# Altium schematic sheet Alimentación.SchDoc
size A4; SheetNumber: 3; SheetTotal: 7
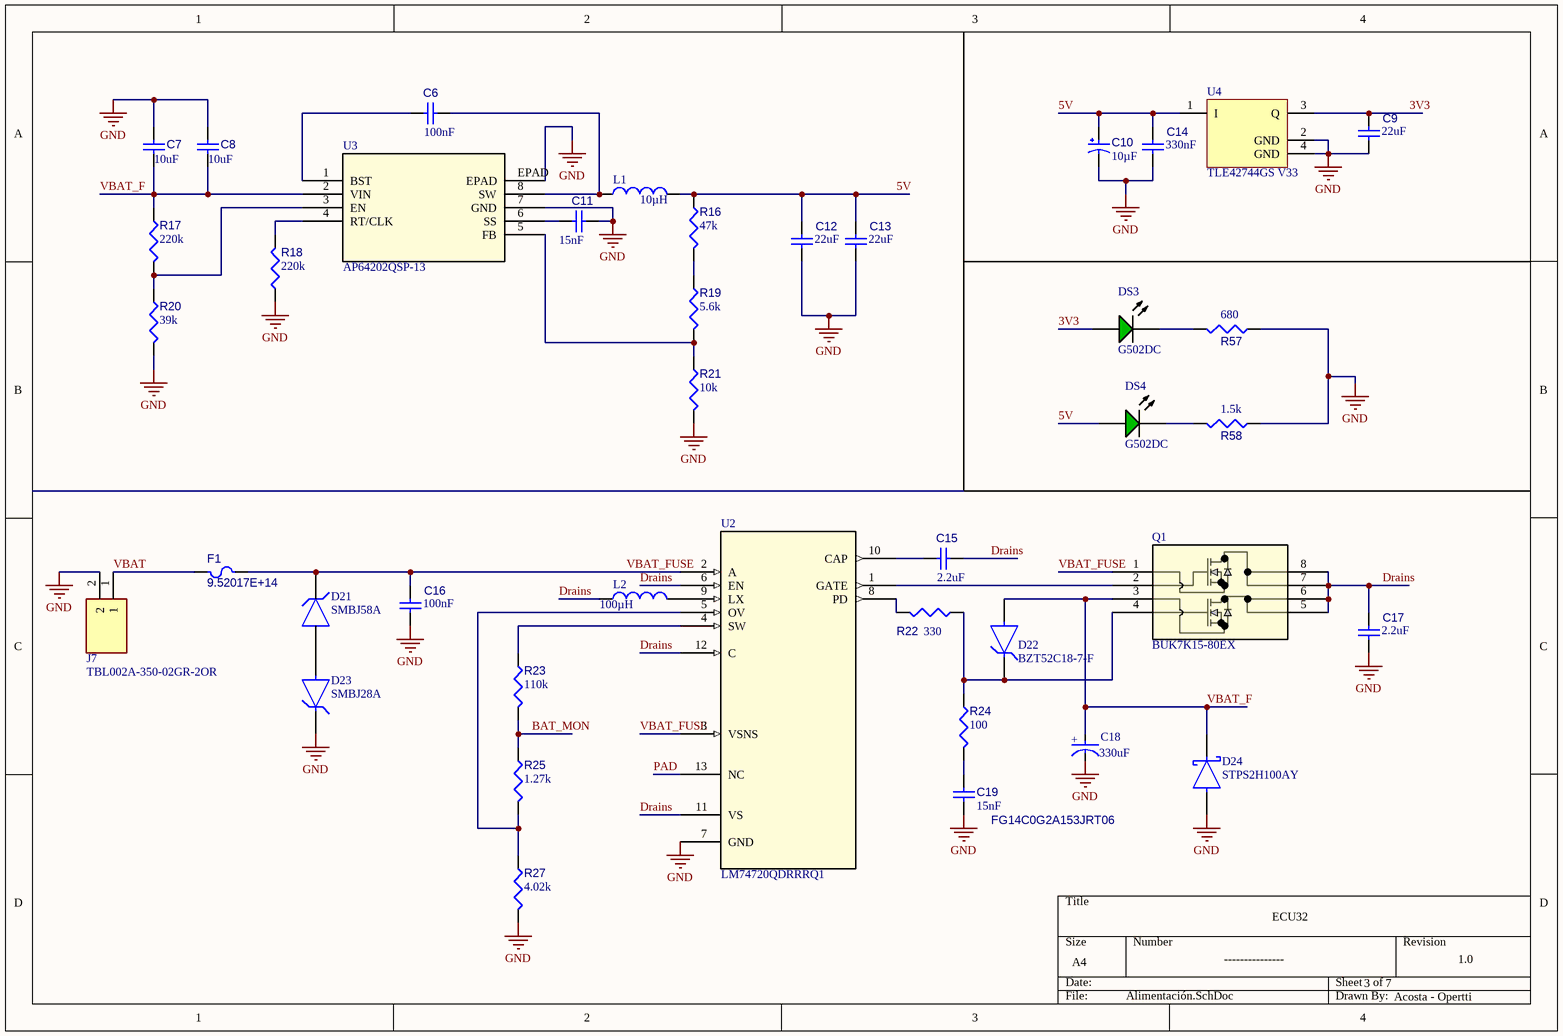
[diagram p0: Alimentación.SchDoc]

## Parts
C6  value 100nF  [Capacitor cerámico TH-Footprint-1]  (hidden comment: Capacitor cerámico TH)
C7  value 10uF  [Capacitor cerámico TH-Footprint-1]  (hidden comment: Capacitor cerámico TH)
C8  value 10uF  [Capacitor cerámico TH-Footprint-1]  (hidden comment: Capacitor cerámico TH)
C9  value 22uF  [Capacitor cerámico TH-Footprint-1]  (hidden comment: Capacitor cerámico TH)
C10  value 10µF  [CAPPR55-200-1100X500X1200]  (hidden comment: ECA1HM100)
C11  value 15nF  [Capacitor cerámico TH-Footprint-1]  (hidden comment: Capacitor cerámico TH)
C12  value 22uF  [Capacitor cerámico TH-Footprint-1]  (hidden comment: Capacitor cerámico TH)
C13  value 22uF  [Capacitor cerámico TH-Footprint-1]  (hidden comment: Capacitor cerámico TH)
C14  value 330nF  [Capacitor cerámico TH-Footprint-1]  (hidden comment: Capacitor cerámico TH)
C15  value 2.2uF  [Capacitor cerámico TH-Footprint-1]  (hidden comment: Capacitor cerámico TH)
C16  value 100nF  [Capacitor cerámico TH-Footprint-1]  (hidden comment: Capacitor cerámico TH)
C17  value 2.2uF  [Capacitor cerámico TH-Footprint-1]  (hidden comment: Capacitor cerámico TH)
C18  330uF  [FP-RAD-TH-D_10_0_5-L_16_1-MFG]
C19  FG14C0G2A153JRT06  value 15nF  [FG14C0G2A153JRT06-Footprint-1]
D21  SMBJ58A  [FP-SMBJ-MFG]
D22  BZT52C18-7-F  [FP-SOD123-MFG]
D23  SMBJ28A  [FP-SMBJ-MFG]
D24  STPS2H100AY  [FP-SMA-MFG]
DS3  G502DC  [CGX-G502DC]
DS4  G502DC  [CGX-G502DC]
F1  9.52017E+14  [9.52017E+14-Footprint-1]
J7  TBL002A-350-02GR-2OR  [CUI_TBL002A-350-02GR-2OR]
L1  value 10µH  [INDC115100X400M]  (hidden comment: HPAL1V1040-100-R)
L2  value 100µH  [SRN6045TA-101M-Footprint-1]  (hidden comment: SRN6045TA-101M)
Q1  BUK7K15-80EX  [BUK7K15-80EX-Footprint-1]
R16  value 47k  [RESA60-630X240]  (hidden comment: MFR-25FBF52-47R5)
R17  value 220k  [RESA60-630X240]  (hidden comment: MFR-25FBF52-47R5)
R18  value 220k  [RESA60-630X240]  (hidden comment: MFR-25FBF52-47R5)
R19  value 5.6k  [RESA60-630X240]  (hidden comment: MFR-25FBF52-47R5)
R20  value 39k  [RESA60-630X240]  (hidden comment: MFR-25FBF52-47R5)
R21  value 10k  [RESA60-630X240]  (hidden comment: MFR-25FBF52-47R5)
R22  value 330  [RESA60-630X240]  (hidden comment: MFR-25FBF52-47R5)
R23  value 110k  [RESA60-630X240]  (hidden comment: MFR-25FBF52-47R5)
R24  value 100  [RESA60-630X240]  (hidden comment: MFR-25FBF52-47R5)
R25  value 1.27k  [RESA60-630X240]  (hidden comment: MFR-25FBF52-47R5)
R27  value 4.02k  [RESA60-630X240]  (hidden comment: MFR-25FBF52-47R5)
R57  value 680  [RESA60-630X240]  (hidden comment: MFR-25FBF52-47R5)
R58  value 1.5k  [RESA60-630X240]  (hidden comment: MFR-25FBF52-47R5)
U2  LM74720QDRRRQ1  [LM74720QDRRRQ1-Footprint-1]
U3  AP64202QSP-13  [IC8_AP64202SP-13_DIO]
U4  TLE42744GS V33  [INF-PG-SOT223_SC-73_M]

## Nets
GND: C7.2 C8.2 C9.1 C10.2 C11.2 C12.2 C13.2 C14.1 C16.1 C17.1 C18.1(C) C19.1 D23.1(C) D24.2(A) J7.2 R18.1 R20.2 R21.2 R27.2 R57.2 R58.2 U2.7(GND) U3.7(GND) U3.EPAD U4.2(GND) U4.4(GND)
3V3: C9.2 DS3.1(A) U4.3(Q)
5V: C10.1 C12.1 C13.1 C14.2 DS4.1(A) L1.2 R16.1 U4.1(I)
BAT_MON: R23.2 R25.1
Drains: C15.2 C17.2 L2.1 Q1.5 Q1.6 Q1.7 Q1.8 U2.6(EN) U2.11(VS) U2.12(C)
PAD: U2.13(NC)
VBAT: F1.1 J7.1
VBAT_F: C7.1 C8.1 C18.2(A) D22.2(A) D24.1(K) Q1.3 R17.1 U3.2(VIN)
VBAT_FUSE: C16.2 D21.1(C) F1.2 Q1.1 U2.2(A) U2.3(VSNS)
NetC6_1: C6.1 U3.1(BST)
NetC6_2: C6.2 L1.1 U3.8(SW)
NetC11_1: C11.1 U3.6(SS)
NetC15_1: C15.1 U2.10(CAP)
NetC19_2: C19.2 R24.2
NetD21_2: D21.2(A) D23.2(A)
NetD22_1: D22.1(C) Q1.4 R22.1 R24.1
NetDS3_2: DS3.2(K) R57.1
NetDS4_2: DS4.2(K) R58.1
NetL2_2: L2.2 U2.9(LX)
NetQ1_2: Q1.2 U2.1(GATE)
NetR16_2: R16.2 R19.1
NetR17_2: R17.2 R20.1 U3.3(EN)
NetR18_2: R18.2 U3.4(RT/CLK)
NetR19_2: R19.2 R21.1 U3.5(FB)
NetR22_2: R22.2 U2.8(PD)
NetR23_1: R23.1 U2.4(SW)
NetR25_2: R25.2 R27.1 U2.5(OV)

## Notes on the sheet
- ECU32
- ---------------
- 3
- 7
- 1.0
- Acosta - Opertti
- (in symbol CMP-05427-000698-1) +

## Library data of the parts
C6-C9 C11-C17 = CMP-001-00083-4
C10 = CMP-001-00025-7: Aluminum Electrolytic Capacitor, 10 uF, +/- 20%, 50 V, -40 to 85 degC, 2-Pin THD, RoHS, Bulk; Manufacturer: Panasonic; Ripple Current (AC): 65mA; Voltage Rating: 50V; Mounting Technology: TH; RoHS Compliant: True; Capacitor Type: Electrolytic; Datasheet Version: Rev. 05, 10/2016; Min Operating Temperature: -40°C; Packaging: Bulk; Ripple Current: 65mA; Tolerance: 20%; Max Operating Temperature: 85°C; Datasheet URL: https://industrial.panasonic.com/cdbs/www-data/pdf/RDF0000/ABA0000C1218.pdf; Lead Pitch: 2mm; Pins: 2; Diameter: 5mm; Manufacturer URL: http://www.panasonic.com/; Package Reference: CAPPR55-200-1100X500X1200; Package Description: 2-Pin Radial Lead, Dia 5 mm, Height 12 mm; Case/Package: Radial; Package Quantity: 200
C18 = CMP-05427-000698-1: Aluminum Electrolytic Capacitors (Radial Lead Type) AEC-Q200 Qualified 330uF ±20% 50V; Life (Hours): 2000Hour; Ripple Current: 410mA; Lead Diameter: 0.6mm; Lead/Base Style: Straight; Diameter: 10mm; Termination: Radial; Length: 16mm; Construction: RADIAL; Lead Pitch: 5mm; Mount: Through Hole; Max Operating Temperature: 105°C; Package Quantity: 500; Packaging: Ammo Pack; Voltage Rating (DC): 50V; Contact Plating: Tin; Min Operating Temperature: -55°C; Capacitance: 330uF; Height: 16mm; Series: NHG; Tolerance: 20%; RoHS Compliant: Yes; Case/Package: Radial; Radiation Hardening: No
C19 = CMP-001-00084-1: 卤5% 100V 15nF C0G Plugin Multilayer Ceramic Capacitors MLCC - Leaded ROHS; Tolerance: 5%; Max Operating Temperature: 125°C; Mounting Technology: Through Hole; Min Operating Temperature: -55°C
D21 = CMP-08607-000075-1: TVS DIODE 58V 93.6V DO214AA; Manufacturer: Littelfuse Inc; Breakdown Voltage: 64.4V; Peak Pulse Power: 600W; Automotive Grade: Grade 0; Number Of Channels: 1; Max Junction Temp: +150°C; Peak Pulse Current: 6.5A; Direction: Unidirectional; Manufacturer Part Number: SMBJ58A; Lead Free: Yes; Device Class L3: unset; Temperature: -55°C to +150°C; ComponentLink2URL: https://www.littelfuse.com/~/media/electronics/datasheets/tvs_diodes/littelfuse_tvs_diode_smbj_datasheet.pdf.pdf; Device Class L2: TVS Diodes; RoHS: TRUE; Package: SMBJ; Reverse Standoff Voltage: 58V; Height: 2.61mm; Temperature Range Low: -55°C; Clamping Voltage: 93.6V; Temperature Range High: +150°C; Automotive: Yes; Mouser Description: In a Pack of 20, Littelfuse SMBJ58A, Uni-Directional TVS Diode, 600W, 2-Pin DO-214AA; Digikey Description: TVS DIODE 58V 93.6V DO214AA; Category: Diode; Octopart: https://octopart.com/smbj58a-littelfuse-350994; ComponentLink2Description: Datasheet; Device Class L1: Circuit Protection
D22 = CMP-12792-000007-1: DIODE ZENER 18V 500MW SOD123; Manufacturer: Diodes Inc.; Max Reverse Leakage Current: 0.1uA; Max Zener Voltage: 19.1V; Max Junction Temp: +150°C; Reverse Voltage: 12.6V; Forward Current: 10mA; Standoff Height: 0mm; Zener Impedance: 45Ω; Power Dissipation: 370mW; Temperature Range Low: -65°C; Package: SOD123; Device Class L3: Zener Diodes; Mouser Description: BZT52C18 Series 500 mW 18 V 10 mA Surface Mount Zener Diode - SOD-123; Octopart: https://octopart.com/bzt52c18-7-f-diodes+inc.-326572; Height: 1.45mm; Device Class L1: Discrete Semiconductors; Nom Zener Voltage: 18V; Automotive: No; Device Class L2: Diodes; Category: Diode; Temperature: -65°C to +150°C; Lead Free: Yes; ComponentLink2URL: https://www.diodes.com/assets/Datasheets/ds18004.pdf; Temperature Range High: +150°C; Footprint Url: https://www.diodes.com/assets/Package-Files/SOD123.pdf; Manufacturer Part Number: BZT52C18-7-F; RoHS: TRUE; Digikey Description: DIODE ZENER 18V 500MW SOD123; ComponentLink2Description: Datasheet
D23 = CMP-08607-000081-1: TVS DIODE 28V 45.4V DO214AA; Manufacturer: Littelfuse Inc; Breakdown Voltage: 31.1V; Direction: Unidirectional; Number Of Channels: 1; Peak Pulse Power: 600W; Max Junction Temp: +150°C; Peak Pulse Current: 13.3A; Temperature: -65°C to +150°C; Category: Diode; RoHS: TRUE; Height: 2.61mm; Reverse Standoff Voltage: 28V; Device Class L1: Circuit Protection; Temperature Range Low: -65°C; ComponentLink2Description: Datasheet; Digikey Description: TVS DIODE 28V 45.4V DO214AA; Automotive: No; Package: SMBJ; Mouser Description: Littelfuse SMBJ28A, Uni-Directional TVS Diode, 600W, 2-Pin DO-214AA; ComponentLink2URL: https://www.littelfuse.com/~/media/electronics/datasheets/tvs_diodes/littelfuse_tvs_diode_smbj_datasheet.pdf.pdf; Manufacturer Part Number: SMBJ28A; Octopart: https://octopart.com/smbj28a-littelfuse-350790; Clamping Voltage: 45.4V; Temperature Range High: +150°C; Device Class L3: unset; Device Class L2: TVS Diodes; Lead Free: Yes
D24 = CMP-12187-000021-2: DIODE SCHOTTKY 100V 2A SMA; Peak Non-Repetitive Surge Current: 75A; Forward Voltage: 880mV; Element Configuration: Single; Peak Reverse Current: 1uA; REACH SVHC: No SVHC; Height: 2.45mm; Radiation Hardening: No; Average Rectified Current: 2A; Width: 2.9mm; Number of Pins: 2; Mount: Surface Mount; Lead Free: Lead Free; Max Forward Surge Current (Ifsm): 75A; Max Operating Temperature: 175°C; Case/Package: SMA; Forward Current: 2A; Packaging: Tape and Reel; Max Reverse Voltage (DC): 100V; Length: 4.6mm; Max Repetitive Reverse Voltage (Vrrm): 100V; Min Operating Temperature: -40°C; Max Reverse Leakage Current: 1uA; Package Quantity: 1; Max Surge Current: 75A
DS3 DS4 = CMP-007-00008-2: Green LED, 80 mW, 20 mA, -25 to 85 degC, 2-Pin THD; Manufacturer: Shenzhen CGX; Mounting Technology: TH; Package Reference: G502DC; Datasheet Version: Sep-14; Manufacturer URL: http://szcgx.com/; Package Description: 2-Pin Through Hole Device, Dia 5.9 mm; Datasheet URL: http://datasheet.octopart.com/G502DC-Chengguangxing-datasheet-62330340.pdf; Case/Package: G502DC; RoHS Compliant: Unknown
F1 = CMP-005-00013-1: Wsk-open Fuse Holder 5X20MM Clip
J7 = CMP-002-00076-1: 1~24 Poles, Screwless, 45Â°, 3.50 Pitch, 24~20 (AWG), Terminal Block Connector; MF: Same Sky; Design Item ID: TBL002A-350-02GR-2OR; Source: TBL002A-350-02GR-2OR.SchLib; Component Type: Standard; Check_prices: https://www.snapeda.com/parts/TBL002A-350-02GR-2OR/Same+Sky/view-part/?ref=eda; Pins: 2; Value: *; Case/Package: None; MP: TBL002A-350-02GR-2OR; SnapEDA_Link: https://www.snapeda.com/parts/TBL002A-350-02GR-2OR/Same+Sky/view-part/?ref=snap
L1 = CMP-006-00021-1: General Purpose Inductor, 10uH, 20%, 1 Element, Powdered Iron-Core, SMD, 4539; Max Current Rating: 7.8A; Self Resonant Frequency: 12MHz; Max Operating Temperature: 125°C; Min Operating Temperature: -55°C; Tolerance: 20%
L2 = CMP-006-00022-1: Ind Power Semi-Shielded Wirewound 100uH ±20% 1MHz 15 Q-Factor Ferrite 0.92A T/R; Max Current Rating: 920mA; Self Resonant Frequency: 8.5MHz; Mounting Technology: Surface Mount; Min Operating Temperature: -55°C; Tolerance: 20%; Max Operating Temperature: 125°C; Case/Package: 2424
Q1 = CMP-013-00034-1: Mosfet, Aec-Q101, Dual N-Ch, 80V, Sot1205 Rohs Compliant: Yes; Min Operating Temperature: -55°C; Max Operating Temperature: 175°C
R16-R25 R27 R57 R58 = CMP-009-00058-4: Axial Resistor, 47.5 Ohm, +/- 1%, 0.25 W, -55 to 155 degC, 2-Pin THD, RoHS, Bulk; Manufacturer: Yageo; Voltage Rating: 250V; Power: 250mW; Packaging: Bulk; Package Description: 2-Pin Axial Lead, Dia 2.4 mm, Body Length 6.3 mm; Package Reference: MFR-25; Case/Package: Axial; Tolerance: 1%; RoHS Compliant: True; Package Quantity: 200; Max Operating Temperature: 155°C; Manufacturer URL: http://www.yageo.com/; Datasheet URL: http://www.yageo.com/documents/recent/Yageo%20LR_MFR_2013.pdf; Min Operating Temperature: -55°C; Datasheet Version: Apr-13; Mounting Technology: TH
U2 = CMP-019-00049-1: Automotive, low IQ ideal diode controller with active rectification and load dump protection 12-WSON -40 to 125; Pins: 12
U3 = CMP-010-000000-1: No Description Available; Manufacturer_Name: Diodes Inc; Copyright: Copyright (C) 2026 Ultra Librarian. All rights reserved.; Type: Type; RefDes: RefDes; Design Item ID: AP64202SP-13; Source: AP64202SP-13.SchLib; Manufacturer_Part_Number: AP64202SP-13
U4 = CMP-1109-00085-1: Low Drop Linear Voltage Regulator, 4.7 to 40 V Supply, 3.3 V Output, -40 to 150 degC, PG-SOT223 (SC-73), Reel, Green; Manufacturer: Infineon; Regulator Type: single output; Dropout Voltage: 250 mV; Green: TRUE; Max. Output Current: 400 mA; Typical Quiescent Current: 100 uA; Accuracy: 2 %; Output Voltage: 3.3 V; ComponentLink2URL: http://www.infineon.com/dgdl/TLE42744_DS_11.pdf?folderId=db3a304318f3fe290118f5a433570040&fileId=db3a304327b897500128012ccafe37d2&location=en.Products.Automotive_ICs.Linear_Voltage_Regulators_for_Automotive-Applications.Linear_Voltage_Regulators_-_Selectio; ComponentLink3URL: http://www.infineon.com/dgdl/SOT223-Package_Overview.pdf?folderId=db3a30431936bc4b0119530470b03c3d&fileId=db3a30431936bc4b0119531d40b93c5c; Operating Range: 4.7 to 40 V; PackageVersion: Apr-08; PartNumber: TLE42744GS V33; Packing: Reel; ComponentLink1URL: http://www.infineon.com/; ComponentLink2Description: Datasheet; DatasheetVersion: Rev. 1.1; ComponentLink3Description: Package Specification; PackageDescription: 4-Pin Small Outline Transistor Package, 6.5 x 3.5 mm Body, 2.3 mm Pitch; Mounting Technology: Surface Mount; PackageReference: PG-SOT223 (SC-73); ComponentLink1Description: Manufacturer URL